# Altium schematic sheet 6252-V1.SchDoc
size A3; SheetNumber: 1; SheetTotal: 1
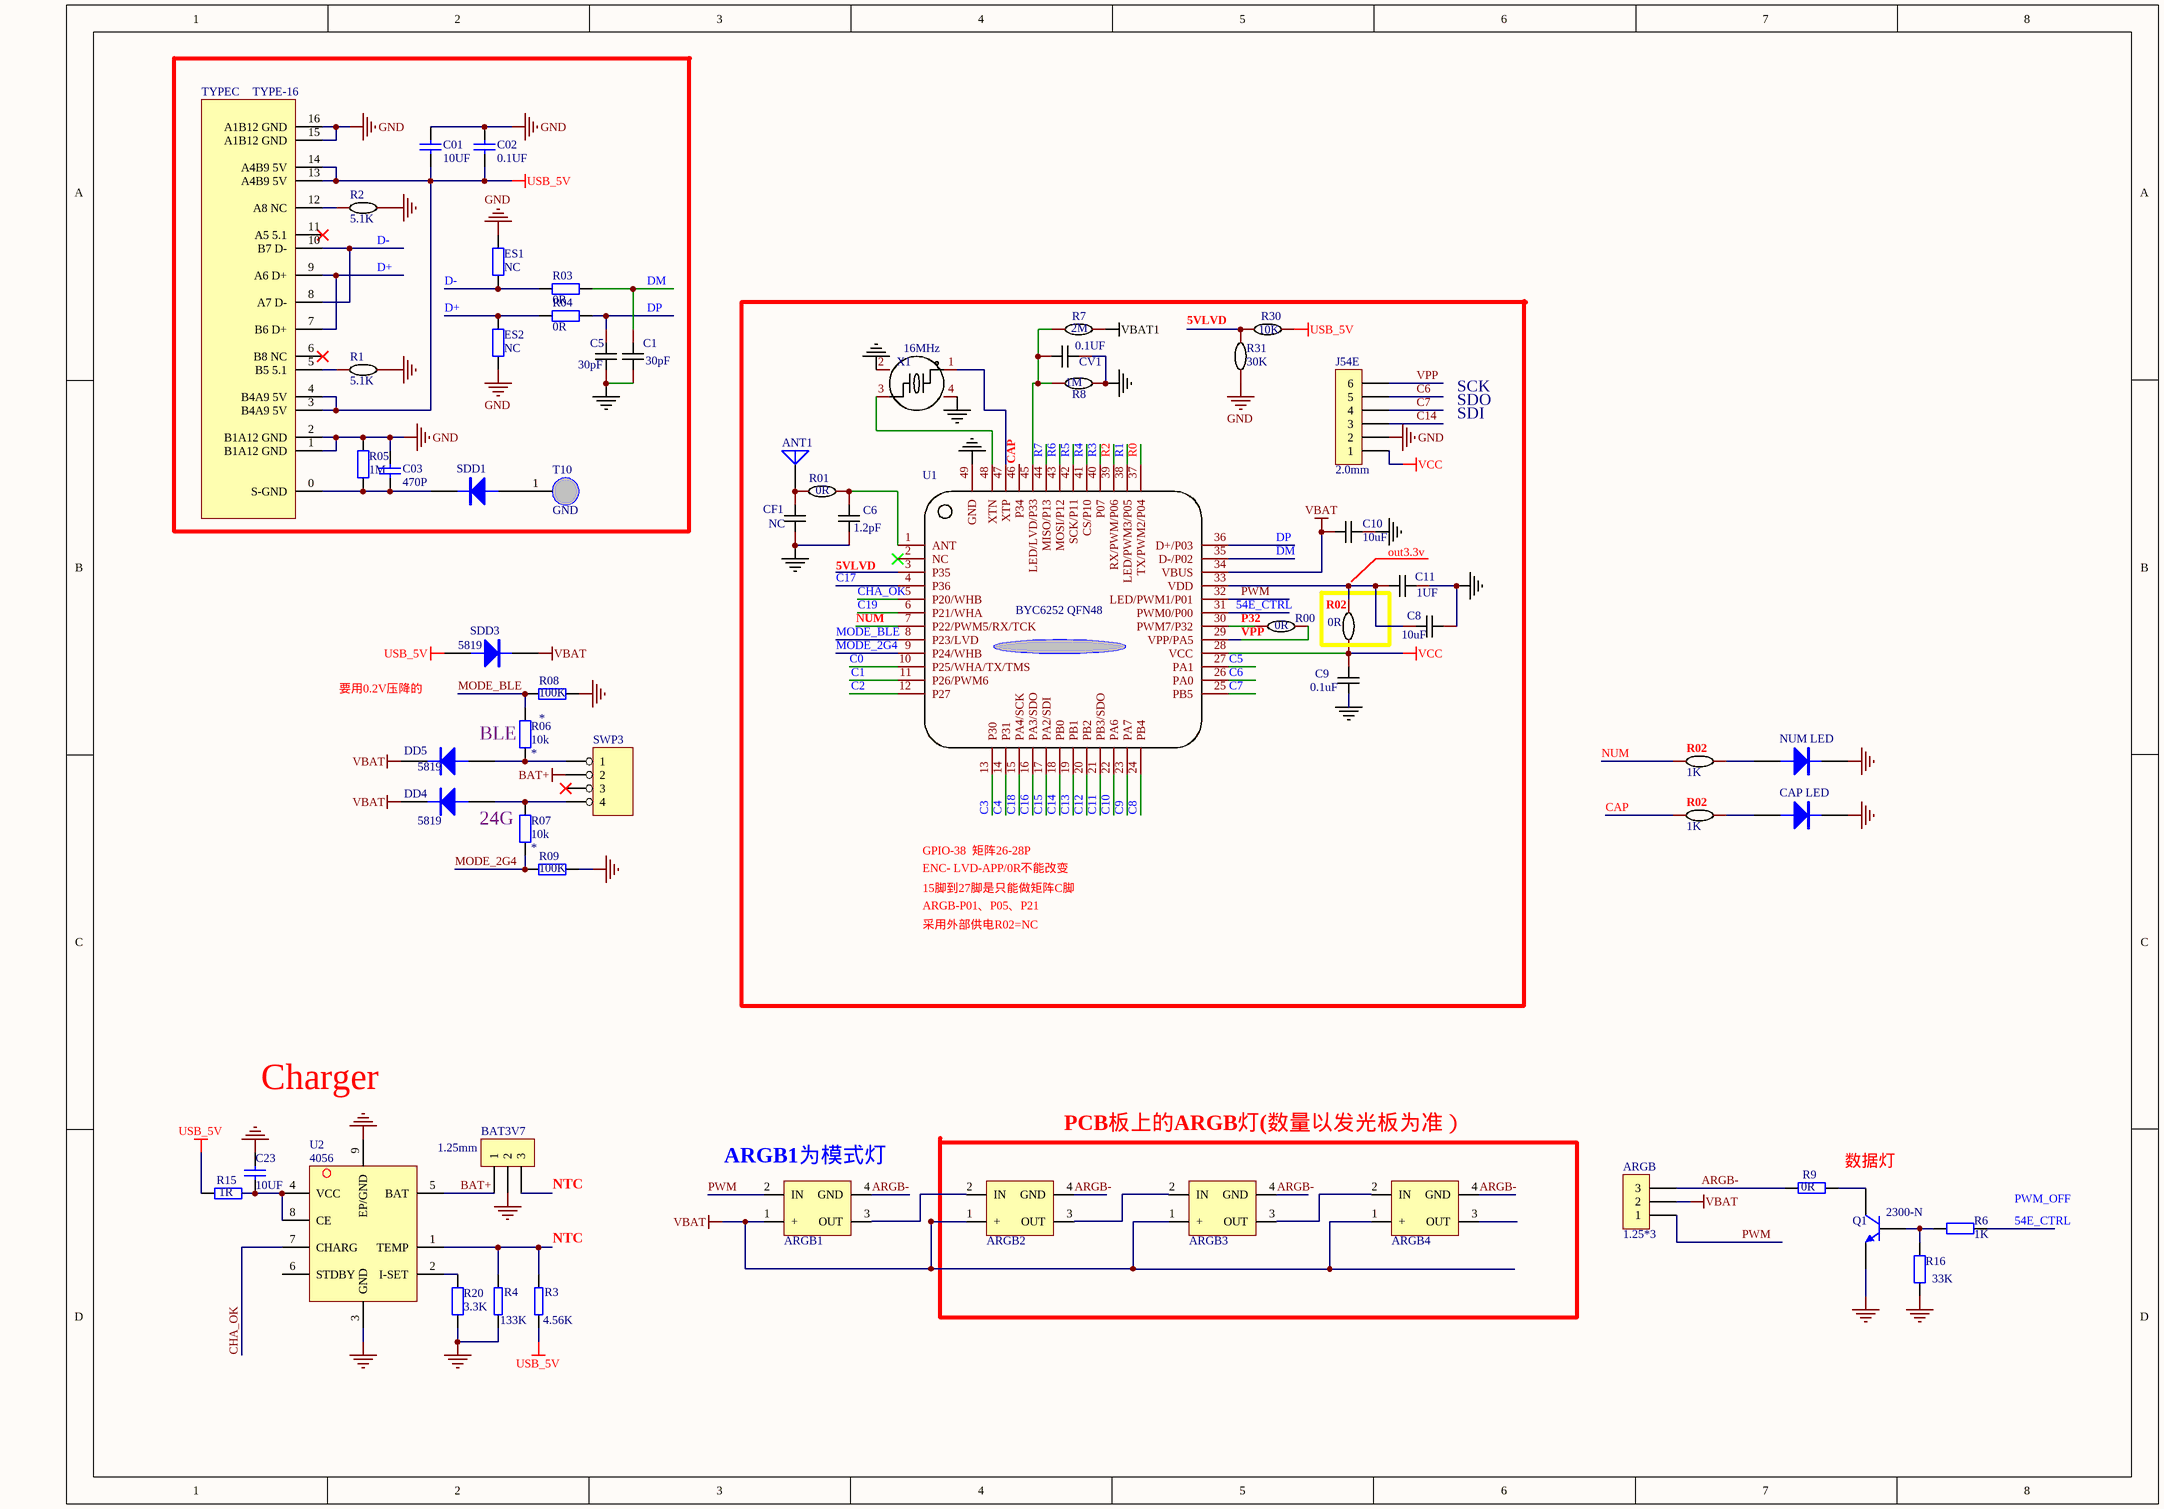
[diagram p0: 6252-V1.SchDoc]

## Parts
(Parts that share a designator on the sheet are numbered #1, #2 ... from top to bottom, then left to right.)
ANT1  A1  [ANT]  (value not drawn)
ARGB  1.25*3  [CON-125-3-S]
ARGB1  (no value)  [3D-A RGB-2121-QFN]
ARGB2  L001  [3D-A RGB-2121-QFN]  (value not drawn)
ARGB3  L001  [3D-A RGB-2121-QFN]  (value not drawn)
ARGB4  L001  [3D-A RGB-2121-QFN]  (value not drawn)
BAT3V7  1.25mm  [CON-125-3-S]
C1  30pF  [0402c]
C01  10UF  [3D-0603]
C02  0.1UF  [0402c]
C03  470P  [0402c]
C5  30pF  [0402c]
C6  1.2pF  [0402c]
C8  10uF  [0603C]
C9  0.1uF  [0402C]
C10  10uF  [0603C]
C11  1UF  [0402c]
C23  10UF  [0603C]
CAP_LED  (no value)  [3D-CD-A(3216)1206]
CF1  Name: NC  [0402c]  (hidden comment: 1.2pF)
CV1  0.1UF  [0402c]
DD4  5819  [3D-CD-A(3216)1206]
DD5  5819  [3D-CD-A(3216)1206]
ES1  NC  [3D-0603R]
ES2  NC  [3D-0603R]
J54E  2.0mm  [CON6-2.0]
NUM_LED  (no value)  [3D-CD-A(3216)1206]
Q1  2300-N  [SOT-23A]
R00  0R  [0402R]
R1  5.1K  [0402R]
R01  0R  [0402R]
R2  5.1K  [0402R]
R02#1  0R  [0402R]
R02#2  1K  [0402R]
R02#3  1K  [0402R]
R03  0R  [3D-0603R]
R3  4.56K  [3D-0603R]
R04  0R  [3D-0603R]
R4  133K  [0603R]
R05  1M  [0402R]
R6  1K  [3D-0603R]
R06  10k  [0603R]
R7  2M  [3D-0603R]
R07  10k  [0603R]
R8  1M  [3D-0603R]
R08  100K  [0603R]
R9  0R  [3D-0603R]
R09  100K  [0603R]
R15  1R  [0805R]
R16  33K  [3D-0603R]
R20  3.3K  [3D-0603R]
R30  10K  [3D-0603R]
R31  30K  [3D-0603R]
SDD1  (no value)  [3D-CD-A(3216)1206]
SDD3  5819  [1206D]
SWP3  (no value)  [SWP1]
T10  GND  [PIN1]
TYPEC  TYPE-16  [TYPE16]
U1  BYC6252 QFN48  [QFN48-6*6]
U2  4056  [3D-SOP8]
X1  16MHz  [3D-3225-4P]

## Nets
BAT+: BAT3V7.1 SWP3.2 U2.5(BAT)
GND: BAT3V7.2 C1.1 C01.1 C02.2 C03.2 C5.1 C6.1 C8.2 C9.2 C10.2 C11.2 C23.1 CAP_LED.2(K) CF1.1 CV1.2 ES1.2 ES2.2 J54E.2 NUM_LED.2(K) Q1.2(E) R4.2 R05.1 R8.1 R08.2 R09.1 R16.1 R20.1 R31.1 TYPEC.1(B1A12_GND) TYPEC.2(B1A12_GND) TYPEC.15(A1B12_GND) TYPEC.16(A1B12_GND) U1.49(GND) U2.3(GND) U2.9(EP/GND) X1.2(GND) X1.4(GND)
NetR1_2: R1.2 R2.1
USB_5V: C01.2 C02.1 R3.1 R15.1 R30.2 SDD3.1(A) TYPEC.3(B4A9_5V) TYPEC.4(B4A9_5V) TYPEC.13(A4B9_5V) TYPEC.14(A4B9_5V)
VBAT: ARGB.2 C10.1 DD4.2(K) DD5.2(K) SDD3.2(K) U1.34(VBUS)
VBAT1: R7.2
VCC: C9.1 J54E.1 R02#1.1 U1.28(VCC)
54E_CTRL: R6.1 U1.31(PWM0/P00)
ARGB-: ARGB.3 ARGB1.4(GND) ARGB2.4(GND) ARGB3.4(GND) ARGB4.4(GND) R9.1
C0: U1.10(P25/WHA/TX/TMS)
C1: U1.11(P26/PWM6)
C2: U1.12(P27)
C3: U1.13(P30)
C4: U1.14(P31)
C5: U1.27(PA1)
C6: J54E.5 U1.26(PA0)
C7: J54E.4 U1.25(PB5)
C8: U1.24(PB4)
C9: U1.23(PA7)
C10: U1.22(PA6)
C11: U1.21(PB3/SDO)
C12: U1.20(PB2)
C13: U1.19(PB1)
C14: J54E.3 U1.18(PB0)
C15: U1.17(PA2/SDI)
C16: U1.16(PA3/SDO)
C17: U1.4(P36)
C18: U1.15(PA4/SCK)
C19: U1.6(P21/WHA)
CAP: R02#3.2 U1.46(P34)
CHA_OK: U1.5(P20/WHB) U2.7(CHARG)
D+: ES2.1 R04.1 TYPEC.7(B6_D+) TYPEC.9(A6_D+)
D-: ES1.1 R03.1 TYPEC.8(A7_D-) TYPEC.10(B7_D-)
DM: C1.2 R03.2 U1.35(D-/P02)
DP: C5.2 R04.2 U1.36(D+/P03)
MODE_2G4: R07.2 R09.2 U1.9(P24/WHB)
MODE_BLE: R06.1 R08.1 U1.8(P23/LVD)
NTC: BAT3V7.3 R3.2 R4.1 U2.1(TEMP)
NUM: R02#2.2 U1.7(P22/PWM5/RX/TCK)
P32: R00.1 U1.30(PWM7/P32)
PWM: ARGB.1 ARGB1.2(IN) U1.32(LED/PWM1/P01)
R0: U1.37(TX/PWM2/P04)
R1: U1.38(LED/PWM3/P05)
R2: U1.39(RX/PWM/P06)
R3: U1.40(P07)
R4: U1.41(CS/P10)
R5: U1.42(SCK/P11)
R6: U1.43(MOSI/P12)
R7: U1.44(MISO/P13)
VPP: J54E.6 R00.2 U1.29(VPP/PA5)
NetANT1_1: ANT1.1 CF1.2 R01.2
NetARGB1_1: ARGB1.1(+) ARGB2.1(+) ARGB3.1(+) ARGB4.1(+)
NetARGB1_3: ARGB1.3(OUT) ARGB2.2(IN)
NetARGB2_3: ARGB2.3(OUT) ARGB3.2(IN)
NetARGB3_3: ARGB3.3(OUT) ARGB4.2(IN)
NetC03_1: C03.1 R05.2 SDD1.2(K) TYPEC.0(S-GND)
NetC6_2: C6.2 R01.1 U1.1(ANT)
NetC8_1: C8.1 C11.1 R02#1.2 U1.33(VDD)
NetC23_2: C23.2 R15.2 U2.4(VCC) U2.8(CE)
NetCAP_LED_1: CAP_LED.1(A) R02#3.1
NetCV1_1: CV1.1 R7.1 R8.2 U1.45(LED/LVD/P33)
NetDD4_1: DD4.1(A) R07.1 SWP3.4
NetDD5_1: DD5.1(A) R06.2 SWP3.1
NetNUM_LED_1: NUM_LED.1(A) R02#2.1
NetQ1_1: Q1.1(B) R6.2 R16.2
NetQ1_3: Q1.3(C) R9.2
NetR1_1: R1.1 TYPEC.5(B5_5.1)
NetR2_2: R2.2 TYPEC.12(A8_NC)
NetR20_2: R20.2 U2.2(I-SET)
NetR30_1: R30.1 R31.2
NetSDD1_1: SDD1.1(A) T10.1
NetU1_47: U1.47(XTP) X1.1
NetU1_48: U1.48(XTN) X1.3

Not connected (* = marked no-connect by the designer): ARGB4 3(OUT); SWP3 3*; TYPEC 6(B8_NC)* 11(A5_5.1)*; U1 2(NC)* 3(P35); U2 6(STDBY)

## Notes on the sheet
- 5VLVD
- SCK
- SDO
- SDI
- (near C6) 5VLVD
- out3.3v
- 要用0.2V压降的
- BLE
- 24G
- GPIO-38  矩阵26-28P
- ENC- LVD-APP/0R不能改变
- 15脚到27脚是只能做矩阵C脚
- ARGB-P01、P05、P21
- 采用外部供电R02=NC
- Charger
- (near ARGB1) ARGB1为模式灯
- PCB板上的ARGB灯(数量以发光板为准）
- (near R9) 数据灯
- Labels drawn without touching a wire or pin: PWM_OFF, VBAT

## Library data of the parts
ANT1 = ANT: Generic Antenna
ARGB BAT3V7 = CON3: Connector
ARGB1-ARGB4 = ARGB2
C1 C5 C6 C8-C10 CF1 = CAP_0603: Symbol: CapAcitance; Convert to PCB: yes; Device: CAP_0603; Add into BOM: yes; Supplier Footprint: 0603
  C1 C5: Name: 30pF; Value: 30pF
  C6: Name: 1.2pF; Value: 1.2pF
  C8 C10: Name: 10uF; Value: 10uF
  C9: Name: 0.1uF; Value: 0.1uF
  CF1: Value: 1.2pF
C01 C02 C03 C23 = Cap: Capacitor; Published: 8-Jun-2000; LatestRevisionDate: 17-Jul-2002; LatestRevisionNote: Re-released for DXP Platform.; PackageReference: RAD-0.3; Publisher: Altium Limited; PackageDescription: Radial Cap, Thru-Hole; 2 Leads; 0.3 in Pin Spacing
  C23: Value: 10UF
C11 CV1 = CAP_0603: Symbol: CapAcitance; Convert to PCB: yes; Value: 10uF; Device: CAP_0603; Add into BOM: yes; Supplier Footprint: 0603
  C11: Name: 1UF
CAP_LED DD4 DD5 NUM_LED SDD1 SDD3 = DIODE
ES1 ES2 R05 R6 R06 R07 R08 R9 R09 R16 = Res2: Resistor
  ES1 ES2: Published: 8-Jun-2000; LatestRevisionDate: 17-Jul-2002; LatestRevisionNote: Re-released for DXP Platform.; PackageReference: AXIAL-0.4; Publisher: Altium Limited; PackageDescription: Axial Device, Thru-Hole; 2 Leads; 0.4 in Pin Spacing; Value: NC
  R05 R6 R9 R16: Published: 8-Jun-2000; LatestRevisionDate: 17-Jul-2002; LatestRevisionNote: Re-released for DXP Platform.; PackageReference: AXIAL-0.4; Publisher: Altium Limited; PackageDescription: Axial Device, Thru-Hole; 2 Leads; 0.4 in Pin Spacing
  R06 R07 R08: Published: *; LatestRevisionDate: *; LatestRevisionNote: *; PackageReference: *; Publisher: *; Value: *
  R09: Published: *; LatestRevisionDate: *; LatestRevisionNote: *; PackageReference: *; Publisher: *
J54E = CON6: Connector
Q1 = SOT-23 SS8050 Y1: 三极管; ComponentLink1Description: 供应商链接; ComponentLink1URL: http://www.szlcsc.com/product/details_2507.html; Package: SOT-23; Supplier: LC; SuppliersPartNumber: C2150
R00-R2 R02#1 R7 R8 = Res_0603: Symbol: 电阻; Convert to PCB: yes; Device: Res_0603; Add into BOM: yes; Supplier Footprint: 0603
  R00 R02#1: Value: 0R
  R1 R2: Name: 5.1K; Value: 5.1K
  R7: Name: 2M; Value: 2M
  R8: Name: 1M; Value: 1M
R01 R30 R31 = Res_0603: Symbol: 电阻; Convert to PCB: yes; Value: 2M; Device: Res_0603; Add into BOM: yes; Supplier Footprint: 0603
R02#2 R02#3 = Res_0603: Symbol: 电阻; Convert to PCB: yes; Value: 0R; Device: Res_0603; Add into BOM: yes; Supplier Footprint: 0603
R03 R04 R15 R20 = Res2: Resistor; Value: NC; Published: 8-Jun-2000; LatestRevisionDate: 17-Jul-2002; LatestRevisionNote: Re-released for DXP Platform.; PackageReference: AXIAL-0.4; Publisher: Altium Limited; PackageDescription: Axial Device, Thru-Hole; 2 Leads; 0.4 in Pin Spacing
R3 R4 = RES2
SWP3 = 4 HEADER: 4 Pin Header
T10 = TEST
TYPEC = USB-16A
U1 = BYC6625 QFN48: Add into BOM: yes; Symbol: BYC6625 QFN48; Device: BYC6625 QFN48; Convert to PCB: yes
U2 = IC-8P
X1 = XL7EL89COI-111YLC-16M: Manufacturer: YXC(扬兴晶振); Add into BOM: yes; Crystal Type: 贴片晶振; Normal temperature Frequency Tolerance: ±10ppm; Name: 16MHz; Symbol: XL7EL89COI-111YLC-16M; Device: XL7EL89COI-111YLC-16M; LCSC Part Name: 16MHz ±10ppm 12pF; Supplier Part: C2965579; Manufacturer Part: XL7EL89COI-111YLC-16M; Supplier Footprint: SMD2016-4P; JLCPCB Part Class: Extended Part; Datasheet: https://atta.szlcsc.com/upload/public/pdf/source/20240329/C26C9A15A73CBCFBF373B30A8E126750.pdf; Supplier: LCSC; Convert to PCB: yes; Value: 16MHz